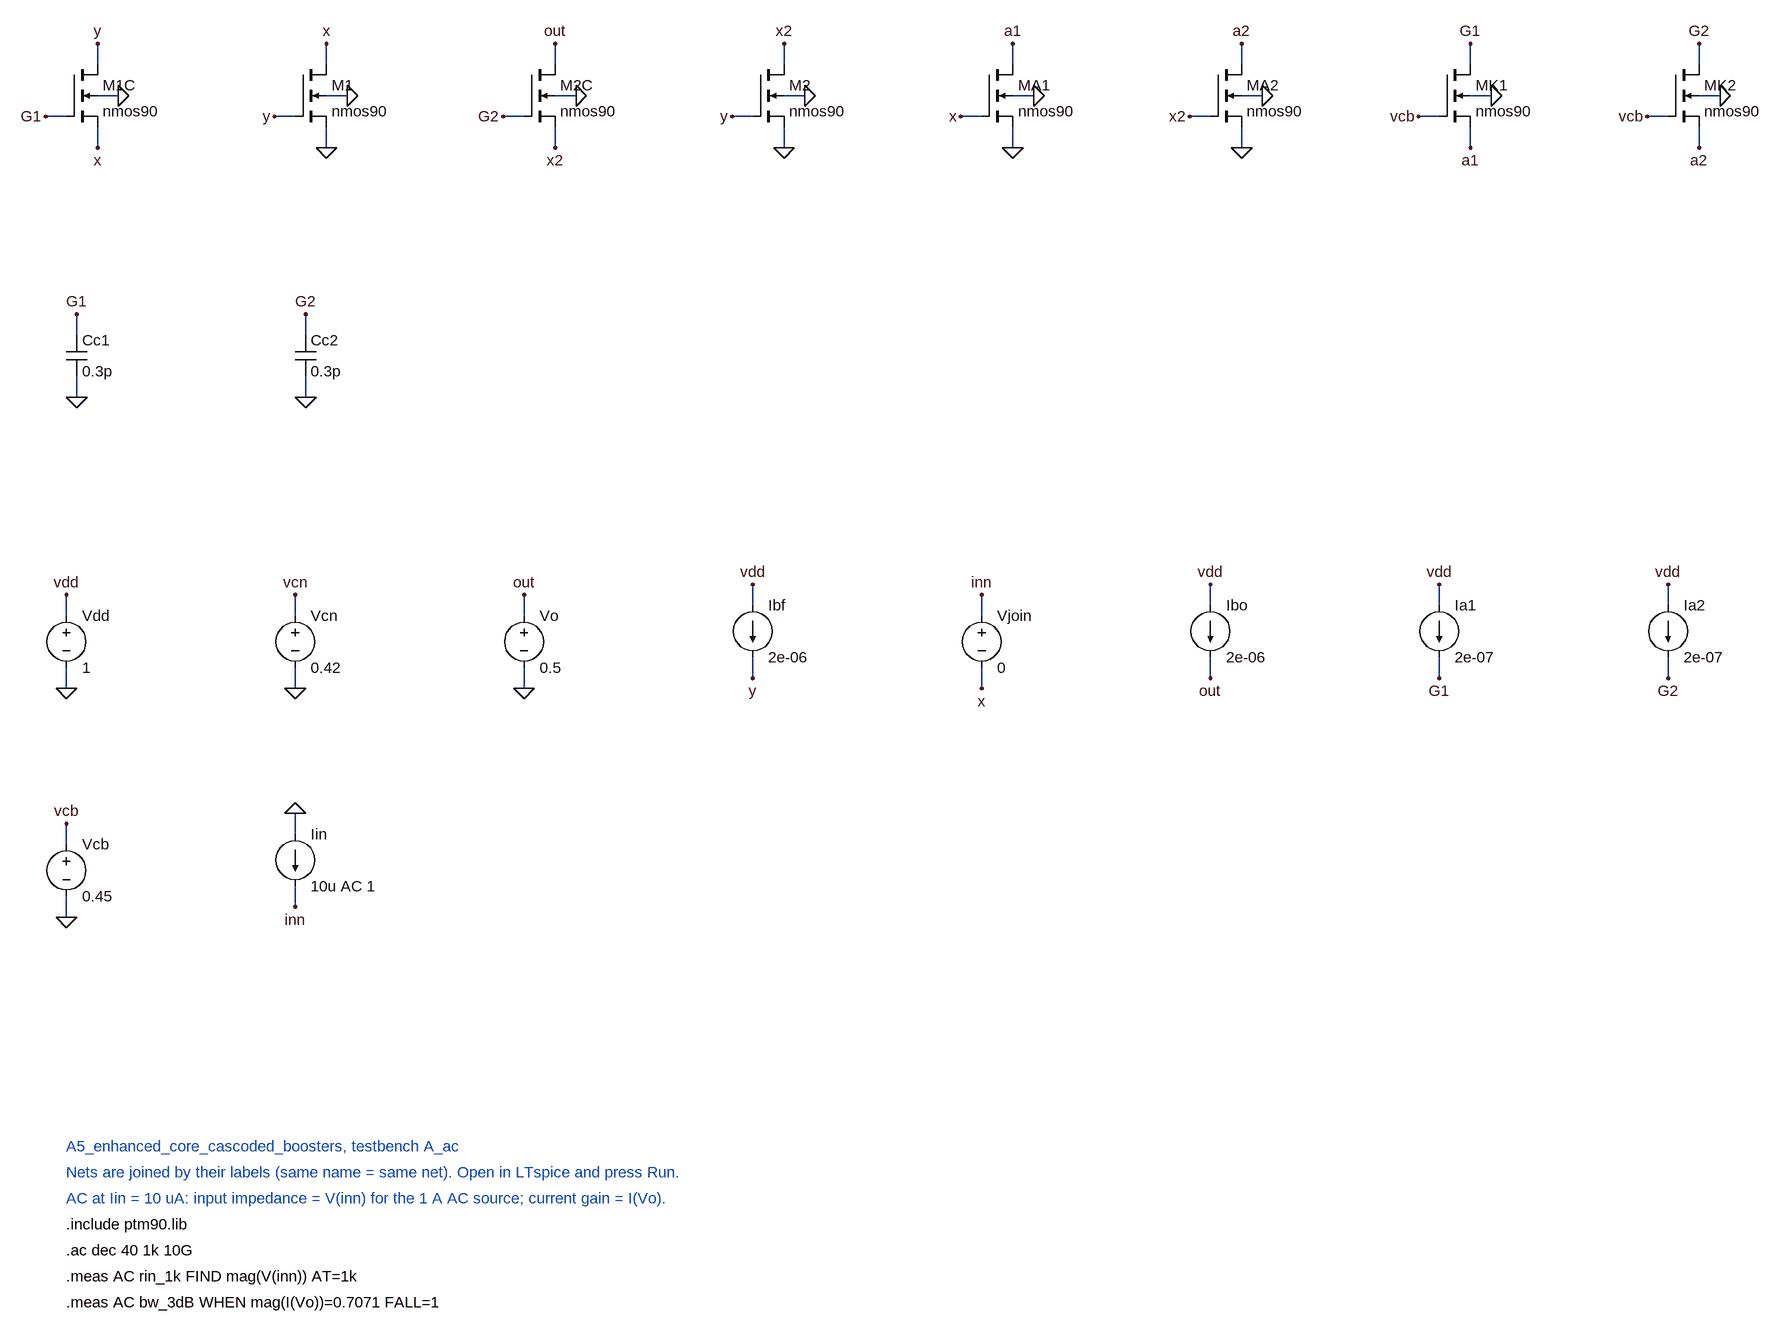
[diagram p0: schematic A5_enhanced_core_cascoded_boosters_A_ac.asc]
A5_enhanced_core_cascoded_boosters_A_ac.asc, the LTspice schematic file:
Version 4
SHEET 1 3200 2400
WIRE 48 0 48 -32
WIRE 0 80 -32 80
WIRE 48 96 48 128
WIRE 48 48 80 48
WIRE 400 0 400 -32
WIRE 352 80 320 80
WIRE 400 96 400 128
WIRE 400 48 432 48
WIRE 752 0 752 -32
WIRE 704 80 672 80
WIRE 752 96 752 128
WIRE 752 48 784 48
WIRE 1104 0 1104 -32
WIRE 1056 80 1024 80
WIRE 1104 96 1104 128
WIRE 1104 48 1136 48
WIRE 1456 0 1456 -32
WIRE 1408 80 1376 80
WIRE 1456 96 1456 128
WIRE 1456 48 1488 48
WIRE 1808 0 1808 -32
WIRE 1760 80 1728 80
WIRE 1808 96 1808 128
WIRE 1808 48 1840 48
WIRE 2160 0 2160 -32
WIRE 2112 80 2080 80
WIRE 2160 96 2160 128
WIRE 2160 48 2192 48
WIRE 2512 0 2512 -32
WIRE 2464 80 2432 80
WIRE 2512 96 2512 128
WIRE 2512 48 2544 48
WIRE 16 416 16 384
WIRE 16 480 16 512
WIRE 368 416 368 384
WIRE 368 480 368 512
WIRE 0 848 0 816
WIRE 0 928 0 960
WIRE 352 848 352 816
WIRE 352 928 352 960
WIRE 704 848 704 816
WIRE 704 928 704 960
WIRE 1056 832 1056 800
WIRE 1056 912 1056 944
WIRE 1408 848 1408 816
WIRE 1408 928 1408 960
WIRE 1760 832 1760 800
WIRE 1760 912 1760 944
WIRE 2112 832 2112 800
WIRE 2112 912 2112 944
WIRE 2464 832 2464 800
WIRE 2464 912 2464 944
WIRE 0 1200 0 1168
WIRE 0 1280 0 1312
WIRE 352 1184 352 1152
WIRE 352 1264 352 1296
FLAG 48 -32 y
FLAG -32 80 G1
FLAG 48 128 x
FLAG 80 48 0
FLAG 400 -32 x
FLAG 320 80 y
FLAG 400 128 0
FLAG 432 48 0
FLAG 752 -32 out
FLAG 672 80 G2
FLAG 752 128 x2
FLAG 784 48 0
FLAG 1104 -32 x2
FLAG 1024 80 y
FLAG 1104 128 0
FLAG 1136 48 0
FLAG 1456 -32 a1
FLAG 1376 80 x
FLAG 1456 128 0
FLAG 1488 48 0
FLAG 1808 -32 a2
FLAG 1728 80 x2
FLAG 1808 128 0
FLAG 1840 48 0
FLAG 2160 -32 G1
FLAG 2080 80 vcb
FLAG 2160 128 a1
FLAG 2192 48 0
FLAG 2512 -32 G2
FLAG 2432 80 vcb
FLAG 2512 128 a2
FLAG 2544 48 0
FLAG 16 384 G1
FLAG 16 512 0
FLAG 368 384 G2
FLAG 368 512 0
FLAG 0 816 vdd
FLAG 0 960 0
FLAG 352 816 vcn
FLAG 352 960 0
FLAG 704 816 out
FLAG 704 960 0
FLAG 1056 800 vdd
FLAG 1056 944 y
FLAG 1408 816 inn
FLAG 1408 960 x
FLAG 1760 800 vdd
FLAG 1760 944 out
FLAG 2112 800 vdd
FLAG 2112 944 G1
FLAG 2464 800 vdd
FLAG 2464 944 G2
FLAG 0 1168 vcb
FLAG 0 1312 0
FLAG 352 1152 0
FLAG 352 1296 inn
SYMBOL nmos4 0 0 R0
SYMATTR InstName M1C
SYMATTR Value nmos90
SYMATTR Value2 W=10u L=360n
SYMBOL nmos4 352 0 R0
SYMATTR InstName M1
SYMATTR Value nmos90
SYMATTR Value2 W=10u L=360n
SYMBOL nmos4 704 0 R0
SYMATTR InstName M2C
SYMATTR Value nmos90
SYMATTR Value2 W=10u L=360n
SYMBOL nmos4 1056 0 R0
SYMATTR InstName M2
SYMATTR Value nmos90
SYMATTR Value2 W=10u L=360n
SYMBOL nmos4 1408 0 R0
SYMATTR InstName MA1
SYMATTR Value nmos90
SYMATTR Value2 W=8u L=360n
SYMBOL nmos4 1760 0 R0
SYMATTR InstName MA2
SYMATTR Value nmos90
SYMATTR Value2 W=8u L=360n
SYMBOL nmos4 2112 0 R0
SYMATTR InstName MK1
SYMATTR Value nmos90
SYMATTR Value2 W=2u L=360n
SYMBOL nmos4 2464 0 R0
SYMATTR InstName MK2
SYMATTR Value nmos90
SYMATTR Value2 W=2u L=360n
SYMBOL cap 0 416 R0
SYMATTR InstName Cc1
SYMATTR Value 0.3p
SYMBOL cap 352 416 R0
SYMATTR InstName Cc2
SYMATTR Value 0.3p
SYMBOL voltage 0 832 R0
SYMATTR InstName Vdd
SYMATTR Value 1
SYMBOL voltage 352 832 R0
SYMATTR InstName Vcn
SYMATTR Value 0.42
SYMBOL voltage 704 832 R0
SYMATTR InstName Vo
SYMATTR Value 0.5
SYMBOL current 1056 832 R0
SYMATTR InstName Ibf
SYMATTR Value 2e-06
SYMBOL voltage 1408 832 R0
SYMATTR InstName Vjoin
SYMATTR Value 0
SYMBOL current 1760 832 R0
SYMATTR InstName Ibo
SYMATTR Value 2e-06
SYMBOL current 2112 832 R0
SYMATTR InstName Ia1
SYMATTR Value 2e-07
SYMBOL current 2464 832 R0
SYMATTR InstName Ia2
SYMATTR Value 2e-07
SYMBOL voltage 0 1184 R0
SYMATTR InstName Vcb
SYMATTR Value 0.45
SYMBOL current 352 1184 R0
SYMATTR InstName Iin
SYMATTR Value 10u AC 1
TEXT 0 1664 Left 2 ;A5_enhanced_core_cascoded_boosters, testbench A_ac
TEXT 0 1704 Left 2 ;Nets are joined by their labels (same name = same net). Open in LTspice and press Run.
TEXT 0 1744 Left 2 ;AC at Iin = 10 uA: input impedance = V(inn) for the 1 A AC source; current gain = I(Vo).
TEXT 0 1784 Left 2 !.include ptm90.lib
TEXT 0 1824 Left 2 !.ac dec 40 1k 10G
TEXT 0 1864 Left 2 !.meas AC rin_1k FIND mag(V(inn)) AT=1k
TEXT 0 1904 Left 2 !.meas AC bw_3dB WHEN mag(I(Vo))=0.7071 FALL=1

The netlist it stands for:
* A5_enhanced_core_cascoded_boosters_A_ac.asc
M1C y G1 x 0 nmos90 W=10u L=360n
M1 x y 0 0 nmos90 W=10u L=360n
M2C out G2 x2 0 nmos90 W=10u L=360n
M2 x2 y 0 0 nmos90 W=10u L=360n
MA1 a1 x 0 0 nmos90 W=8u L=360n
MA2 a2 x2 0 0 nmos90 W=8u L=360n
MK1 G1 vcb a1 0 nmos90 W=2u L=360n
MK2 G2 vcb a2 0 nmos90 W=2u L=360n
Cc1 G1 0 0.3p
Cc2 G2 0 0.3p
Vdd vdd 0 1
Vcn vcn 0 0.42
Vo out 0 0.5
Ibf vdd y 2e-06
Vjoin inn x 0
Ibo vdd out 2e-06
Ia1 vdd G1 2e-07
Ia2 vdd G2 2e-07
Vcb vcb 0 0.45
Iin 0 inn 10u AC 1
.model NMOS NMOS
.model PMOS PMOS
.lib standard.mos
* A5_enhanced_core_cascoded_boosters, testbench A_ac
* Nets are joined by their labels (same name = same net). Open in LTspice and press Run.
* AC at Iin = 10 uA: input impedance = V(inn) for the 1 A AC source; current gain = I(Vo).
.include ptm90.lib
.ac dec 40 1k 10G
.meas AC rin_1k FIND mag(V(inn)) AT=1k
.meas AC bw_3dB WHEN mag(I(Vo))=0.7071 FALL=1
.backanno
.end